# Altium schematic sheet Top-Sheet.SchDoc
size A4; SheetNumber: 1; SheetTotal: 3
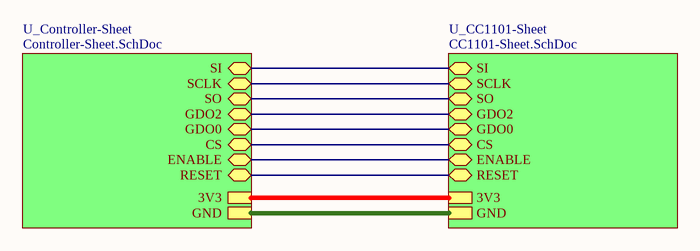
[diagram p0: Top-Sheet.SchDoc]

## Sub-sheets
U_CC1101-Sheet = CC1101-Sheet.SchDoc: SI (bidir), SCLK (bidir), SO (bidir), GDO2 (bidir), GDO0 (bidir), CS (bidir), ENABLE (bidir), RESET (bidir), 3V3, GND
U_Controller-Sheet = Controller-Sheet.SchDoc: SI (bidir), SCLK (bidir), SO (bidir), GDO2 (bidir), GDO0 (bidir), CS (bidir), ENABLE (bidir), RESET (bidir), 3V3, GND

## Nets
(unnamed): sheet U_Controller-Sheet/SI, sheet U_CC1101-Sheet/SI
(unnamed): sheet U_Controller-Sheet/SCLK, sheet U_CC1101-Sheet/SCLK
(unnamed): sheet U_Controller-Sheet/SO, sheet U_CC1101-Sheet/SO
(unnamed): sheet U_Controller-Sheet/GDO2, sheet U_CC1101-Sheet/GDO2
(unnamed): sheet U_Controller-Sheet/GDO0, sheet U_CC1101-Sheet/GDO0
(unnamed): sheet U_Controller-Sheet/CS, sheet U_CC1101-Sheet/CS
(unnamed): sheet U_Controller-Sheet/ENABLE, sheet U_CC1101-Sheet/ENABLE
(unnamed): sheet U_Controller-Sheet/RESET, sheet U_CC1101-Sheet/RESET
(unnamed): sheet U_Controller-Sheet/3V3, sheet U_CC1101-Sheet/3V3
(unnamed): sheet U_Controller-Sheet/GND, sheet U_CC1101-Sheet/GND

## Notes on the sheet
- File:
- Title:
- Date:
- Page
- Num:
- Total:
- Drawn By: Huzaifa Ali